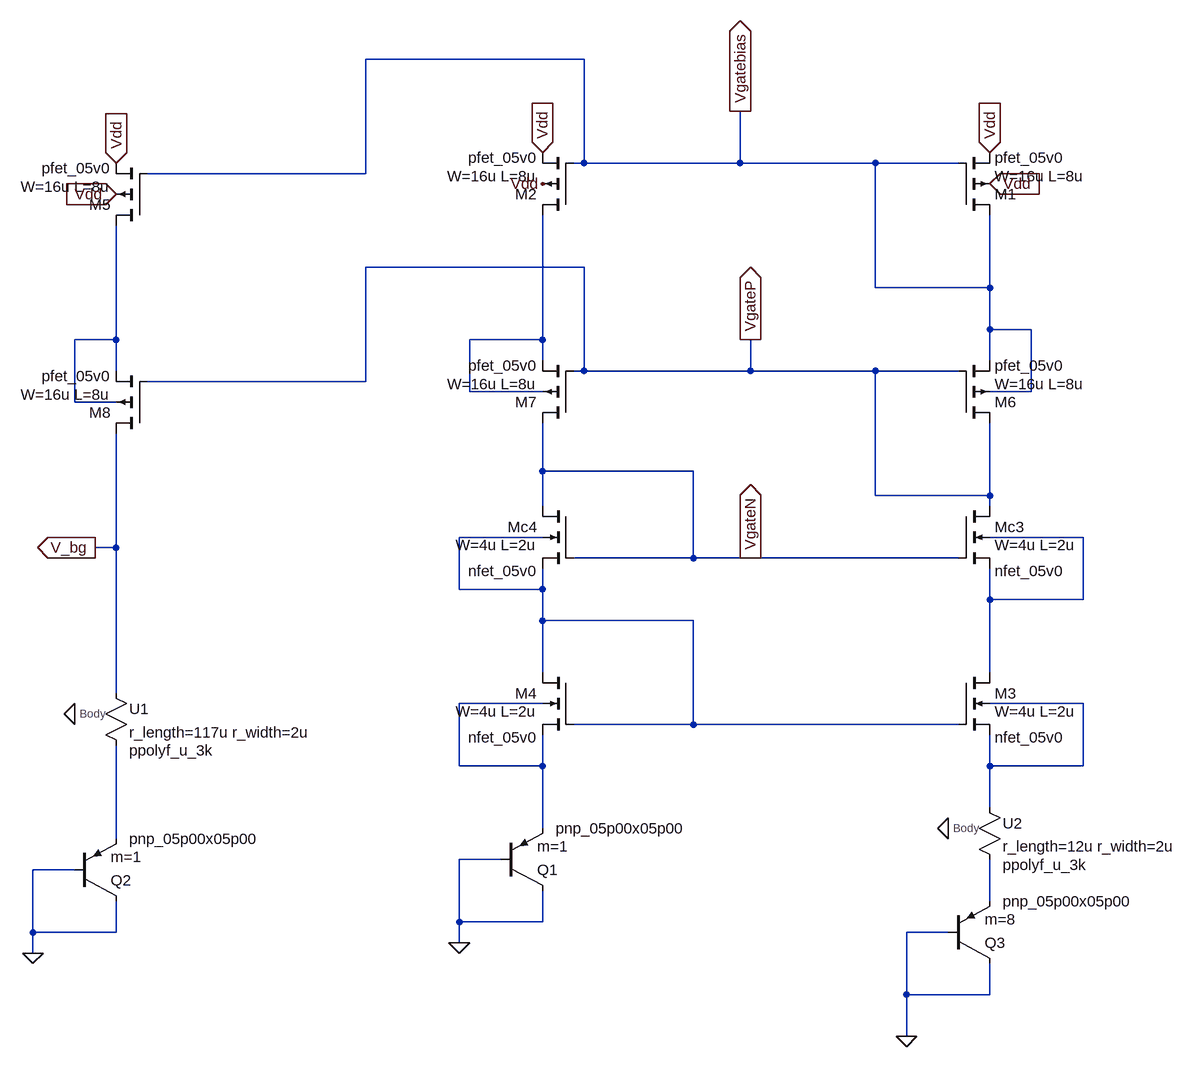
[diagram p0: schematic BGR.asc]
BGR.asc, the LTspice schematic file:
Version 4.1
SHEET 1 1584 828
WIRE 592 -784 256 -784
WIRE 592 -624 592 -784
WIRE 592 -624 576 -624
WIRE 832 -624 832 -704
WIRE 832 -624 592 -624
WIRE 1040 -624 832 -624
WIRE 1168 -624 1040 -624
WIRE 256 -608 256 -784
WIRE 256 -608 -80 -608
WIRE 592 -464 256 -464
WIRE 1040 -432 1040 -624
WIRE 1216 -432 1216 -544
WIRE 1216 -432 1040 -432
WIRE 1216 -368 1216 -432
WIRE 1280 -368 1216 -368
WIRE -128 -352 -128 -528
WIRE -128 -352 -192 -352
WIRE 528 -352 528 -544
WIRE 528 -352 416 -352
WIRE 528 -320 528 -352
WIRE 1216 -320 1216 -368
WIRE -128 -304 -128 -352
WIRE 592 -304 592 -464
WIRE 592 -304 576 -304
WIRE 848 -304 848 -352
WIRE 848 -304 592 -304
WIRE 1040 -304 848 -304
WIRE 1168 -304 1040 -304
WIRE 256 -288 256 -464
WIRE 256 -288 -80 -288
WIRE 416 -272 416 -352
WIRE 528 -272 416 -272
WIRE 1280 -272 1280 -368
WIRE 1280 -272 1216 -272
WIRE -192 -256 -192 -352
WIRE -128 -256 -192 -256
WIRE 528 -150 528 -224
WIRE 760 -150 528 -150
WIRE 1040 -112 1040 -304
WIRE 1216 -112 1216 -224
WIRE 1216 -112 1040 -112
WIRE 528 -96 528 -150
WIRE 1216 -96 1216 -112
WIRE 528 -48 400 -48
WIRE 1360 -48 1216 -48
WIRE -128 -32 -128 -208
WIRE -128 -32 -160 -32
WIRE 760 -16 760 -150
WIRE 760 -16 576 -16
WIRE 848 -16 760 -16
WIRE 1168 -16 848 -16
WIRE 400 32 400 -48
WIRE 528 32 528 0
WIRE 528 32 400 32
WIRE 1216 48 1216 0
WIRE 1360 48 1360 -48
WIRE 1360 48 1216 48
WIRE 528 80 528 32
WIRE 760 80 528 80
WIRE 528 160 528 80
WIRE 1216 160 1216 48
WIRE -128 192 -128 -32
WIRE 528 208 400 208
WIRE 1360 208 1216 208
WIRE 760 240 760 80
WIRE 760 240 576 240
WIRE 1168 240 760 240
WIRE 400 304 400 208
WIRE 528 304 528 256
WIRE 528 304 400 304
WIRE 1216 304 1216 256
WIRE 1360 304 1360 208
WIRE 1360 304 1216 304
WIRE 1216 368 1216 304
WIRE 528 400 528 304
WIRE -128 416 -128 272
WIRE 464 448 400 448
WIRE -192 464 -256 464
WIRE 1216 512 1216 448
WIRE 400 544 400 448
WIRE 528 544 528 496
WIRE 528 544 400 544
WIRE -256 560 -256 464
WIRE -128 560 -128 512
WIRE -128 560 -256 560
WIRE 1152 560 1088 560
WIRE 400 576 400 544
WIRE -256 592 -256 560
WIRE 1088 656 1088 560
WIRE 1216 656 1216 608
WIRE 1216 656 1088 656
WIRE 1088 720 1088 656
FLAG 400 576 0
FLAG 528 -592 Vdd
FLAG 528 -640 Vdd
IOPIN 528 -640 In
FLAG 1216 -640 Vdd
IOPIN 1216 -640 In
FLAG -256 592 0
FLAG -128 -624 Vdd
IOPIN -128 -624 In
FLAG -160 -32 V_bg
IOPIN -160 -32 Out
FLAG -128 -576 Vdd
IOPIN -128 -576 In
FLAG 1216 -592 Vdd
IOPIN 1216 -592 In
FLAG -192 224 0
FLAG 1088 720 0
FLAG 1152 400 0
FLAG 848 -352 VgateP
IOPIN 848 -352 Out
FLAG 848 -16 VgateN
IOPIN 848 -16 Out
FLAG 832 -704 Vgatebias
IOPIN 832 -704 Out
SYMBOL pmos4 1168 -544 M180
WINDOW 3 56 60 Left 2
WINDOW 38 56 88 Left 2
SYMATTR Value W=16u L=8u
SYMATTR SpiceModel pfet_05v0
SYMATTR InstName M1
SYMATTR Prefix X
SYMBOL pmos4 576 -544 R180
WINDOW 3 56 60 Left 2
WINDOW 38 56 88 Left 2
SYMATTR Value W=16u L=8u
SYMATTR SpiceModel pfet_05v0
SYMATTR InstName M2
SYMATTR Prefix X
SYMBOL nmos4 1168 160 R0
WINDOW 3 56 60 Left 2
WINDOW 38 56 100 Left 2
SYMATTR Value W=4u L=2u
SYMATTR SpiceModel nfet_05v0
SYMATTR InstName M3
SYMATTR Prefix X
SYMBOL nmos4 576 160 M0
WINDOW 3 56 60 Left 2
WINDOW 38 56 100 Left 2
SYMATTR Value W=4u L=2u
SYMATTR SpiceModel nfet_05v0
SYMATTR InstName M4
SYMATTR Prefix X
SYMBOL pnp 464 496 M180
WINDOW 38 84 96 Left 2
SYMATTR SpiceModel pnp_05p00x05p00
SYMATTR InstName Q1
SYMATTR Value m=1
SYMATTR Prefix X
SYMBOL pmos4 -80 -528 R180
WINDOW 3 56 60 Left 2
WINDOW 38 56 88 Left 2
SYMATTR Value W=16u L=8u
SYMATTR SpiceModel pfet_05v0
SYMATTR InstName M5
SYMATTR Prefix X
SYMBOL pnp -192 512 M180
WINDOW 38 84 96 Left 2
SYMATTR SpiceModel pnp_05p00x05p00
SYMATTR InstName Q2
SYMATTR Value m=1
SYMATTR Prefix X
SYMBOL res3 -144 176 R0
WINDOW 38 36 104 Left 2
SYMATTR SpiceModel ppolyf_u_3k
SYMATTR InstName U1
SYMATTR Value r_length=117u r_width=2u
SYMBOL pnp 1152 608 M180
WINDOW 38 84 96 Left 2
SYMATTR SpiceModel pnp_05p00x05p00
SYMATTR InstName Q3
SYMATTR Value m=8
SYMATTR Prefix X
SYMBOL res3 1200 352 R0
WINDOW 38 36 104 Left 2
SYMATTR SpiceModel ppolyf_u_3k
SYMATTR InstName U2
SYMATTR Value r_length=12u r_width=2u
SYMBOL nmos4 576 -96 M0
WINDOW 3 56 60 Left 2
WINDOW 38 56 100 Left 2
SYMATTR Value W=4u L=2u
SYMATTR SpiceModel nfet_05v0
SYMATTR InstName Mc4
SYMATTR Prefix X
SYMBOL nmos4 1168 -96 R0
WINDOW 3 56 60 Left 2
WINDOW 38 56 100 Left 2
SYMATTR Value W=4u L=2u
SYMATTR SpiceModel nfet_05v0
SYMATTR InstName Mc3
SYMATTR Prefix X
SYMBOL pmos4 1168 -224 M180
WINDOW 3 56 60 Left 2
WINDOW 38 56 88 Left 2
SYMATTR Value W=16u L=8u
SYMATTR SpiceModel pfet_05v0
SYMATTR InstName M6
SYMATTR Prefix X
SYMBOL pmos4 576 -224 R180
WINDOW 3 56 60 Left 2
WINDOW 38 56 88 Left 2
SYMATTR Value W=16u L=8u
SYMATTR SpiceModel pfet_05v0
SYMATTR InstName M7
SYMATTR Prefix X
SYMBOL pmos4 -80 -208 R180
WINDOW 3 56 60 Left 2
WINDOW 38 56 88 Left 2
SYMATTR Value W=16u L=8u
SYMATTR SpiceModel pfet_05v0
SYMATTR InstName M8
SYMATTR Prefix X

The netlist it stands for:
* BGR.asc
X§M1 Vgatebias Vgatebias Vdd Vdd pfet_05v0 W=16u L=8u  ; pins D G S B
X§M2 N002 Vgatebias Vdd Vdd pfet_05v0 W=16u L=8u  ; pins D G S B
X§M3 N004 N003 N006 N006 nfet_05v0 W=4u L=2u  ; pins D G S B
X§M4 N003 N003 N005 N005 nfet_05v0 W=4u L=2u  ; pins D G S B
X§Q1 0 0 N005 pnp_05p00x05p00 m=1  ; pins C B E
X§M5 N001 Vgatebias Vdd Vdd pfet_05v0 W=16u L=8u  ; pins D G S B
X§Q2 0 0 N007 pnp_05p00x05p00 m=1  ; pins C B E
X§U1 V_bg N007 0 ppolyf_u_3k r_length=117u r_width=2u  ; pins A B Body
X§Q3 0 0 N008 pnp_05p00x05p00 m=8  ; pins C B E
X§U2 N006 N008 0 ppolyf_u_3k r_length=12u r_width=2u  ; pins A B Body
X§Mc4 VgateN VgateN N003 N003 nfet_05v0 W=4u L=2u  ; pins D G S B
X§Mc3 VgateP VgateN N004 N004 nfet_05v0 W=4u L=2u  ; pins D G S B
X§M6 VgateP VgateP Vgatebias Vgatebias pfet_05v0 W=16u L=8u  ; pins D G S B
X§M7 VgateN VgateP N002 N002 pfet_05v0 W=16u L=8u  ; pins D G S B
X§M8 V_bg VgateP N001 N001 pfet_05v0 W=16u L=8u  ; pins D G S B
.backanno
.end